# EAGLE design source_eagle (EAGLE 6.5.0)
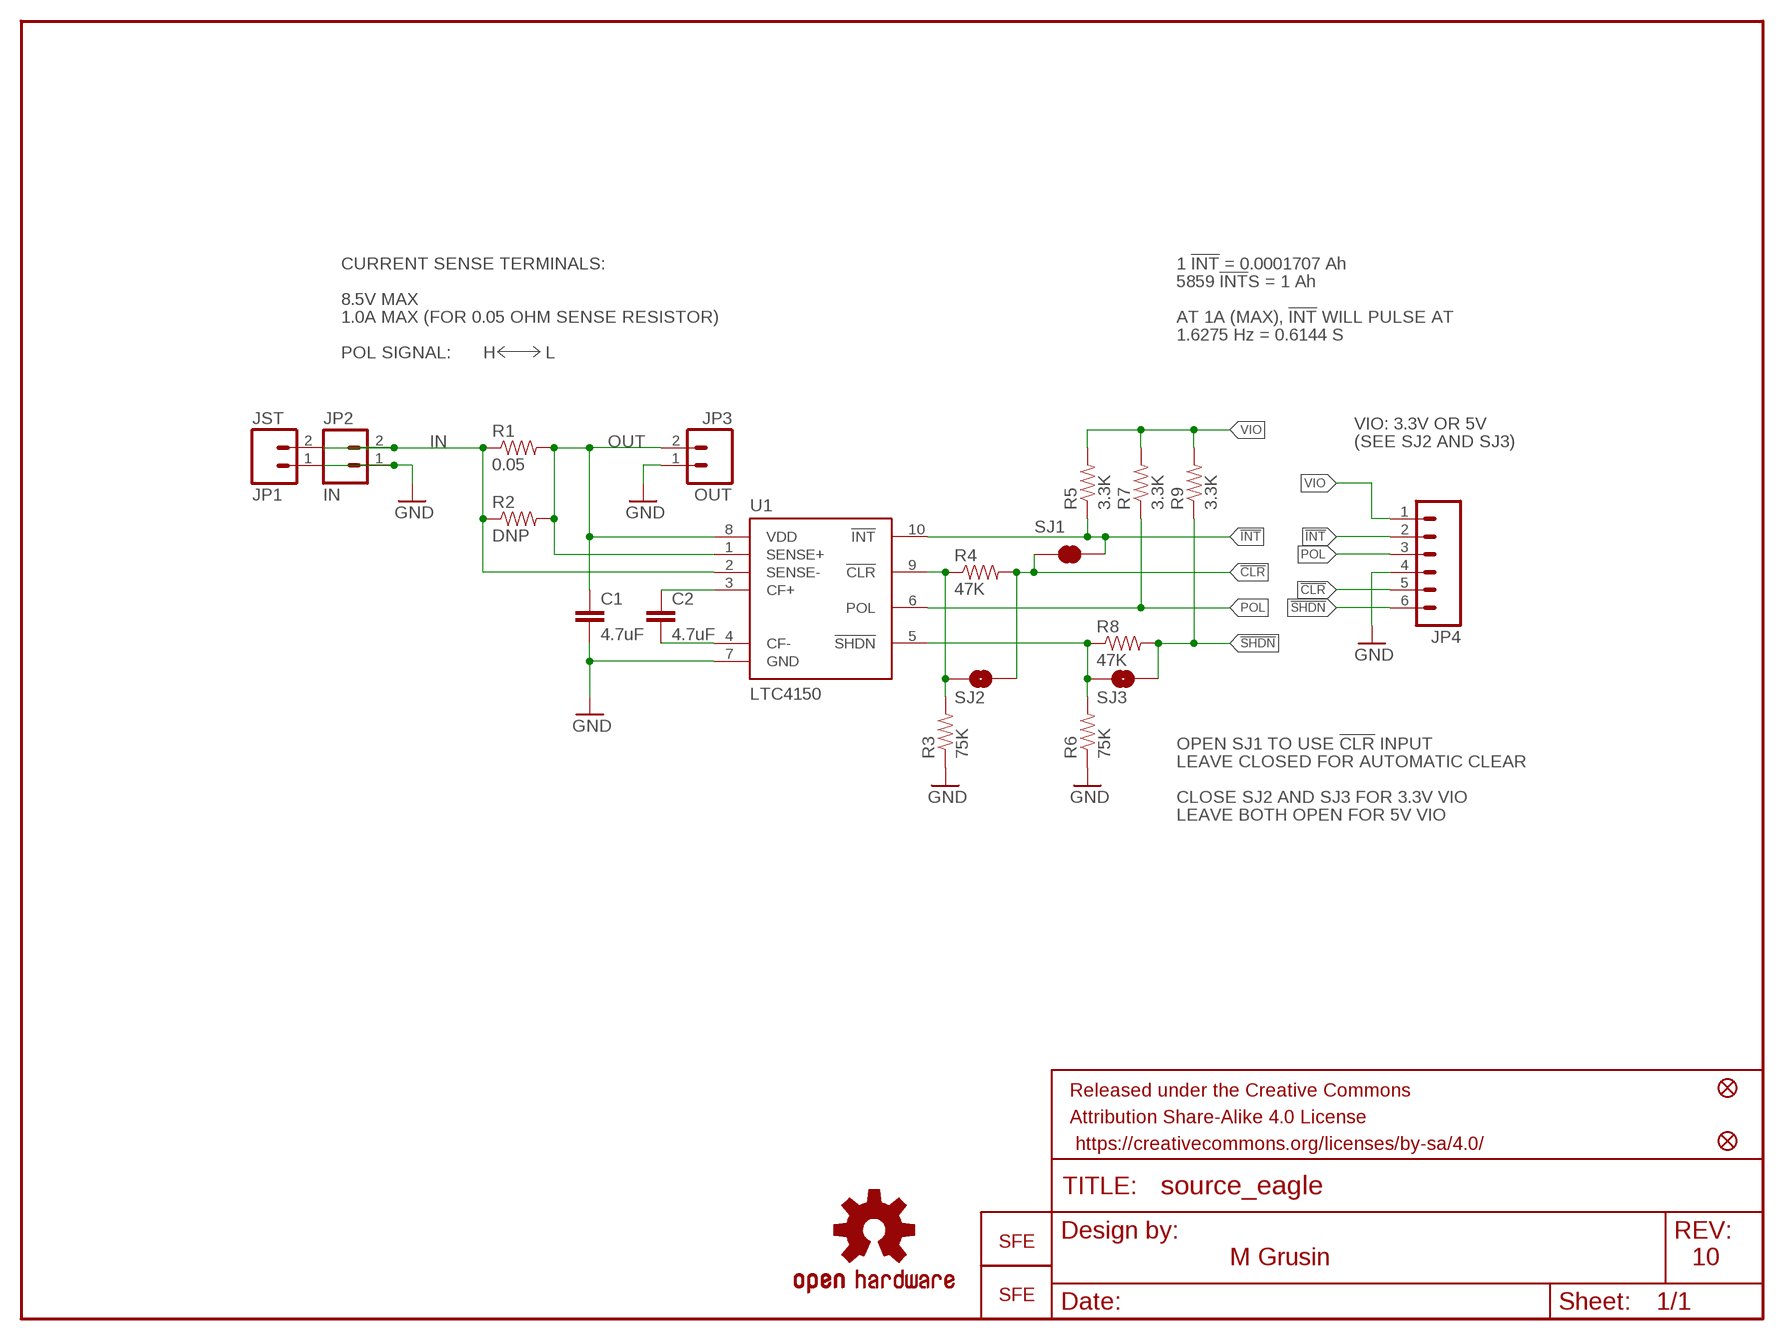
[diagram p0: schematic, sheet 1]

## Parts
C1  4.7uF  CAP0603-CAP  [0603-CAP]
C2  4.7uF  CAP0603-CAP  [0603-CAP]
FID1  FIDUCIAL1X2  [FIDUCIAL-1X2]
FID2  FIDUCIAL1X2  [FIDUCIAL-1X2]
FRAME1  FRAME-LETTER  [CREATIVE_COMMONS]
JP1  JST  M02-JST-2MM-SMT  [JST-2-SMD]
JP2  IN  M02PTH  [1X02]
JP3  OUT  M02PTH  [1X02]
JP4  M06SIP  [1X06]
LOGO1  OSHW-LOGOS  [OSHW-LOGO-S]
LOGO2  LOGO-SFENW2  [SFE-NEW-WEB]
LOGO3  LOGO-SFESK  [SFE-LOGO-FLAME]
R1  0.05  RESISTOR1206  [1206]
R2  DNP  RESISTORAXIAL-0.3  [AXIAL-0.3]
R3  75K  RESISTOR0603-RES  [0603-RES]
R4  47K  RESISTOR0603-RES  [0603-RES]
R5  3.3K  RESISTOR0603-RES  [0603-RES]
R6  75K  RESISTOR0603-RES  [0603-RES]
R7  3.3K  RESISTOR0603-RES  [0603-RES]
R8  47K  RESISTOR0603-RES  [0603-RES]
R9  3.3K  RESISTOR0603-RES  [0603-RES]
SJ1  SOLDERJUMPERNC  [SJ_2S]
SJ2  SOLDERJUMPERNO  [SJ_2S-NO]
SJ3  SOLDERJUMPERNO  [SJ_2S-NO]
U1  LTC4150  [MSOP10]

## Nets
!CLR!: JP4.5 R4.2 SJ1.1 SJ2.2
!INT!: JP4.2 R5.1 SJ1.2 U1.10(!INT!)
!SHDN!: JP4.6 R8.2 R9.1 SJ3.2
GND: C1.2 JP1.1 JP2.1 JP3.1 JP4.4 R3.1 R6.1 U1.7(GND)
IN: JP1.2 JP2.2 R1.1 R2.P$1 U1.2(SENSE-)
N$1: R3.2 R4.1 SJ2.1 U1.9(!CLR!)
N$3: C2.1 U1.3(CF+)
N$4: C2.2 U1.4(CF-)
N$9: R6.2 R8.1 SJ3.1 U1.5(!SHDN!)
OUT: C1.1 JP3.2 R1.2 R2.P$2 U1.1(SENSE+) U1.8(VDD)
POL: JP4.3 R7.1 U1.6(POL)
VIO: JP4.1 R5.2 R7.2 R9.2

## Notes on the sheet
- CURRENT SENSE TERMINALS: | 1 !INT! = 0.0001707 Ah
- 5859 !INT!S = 1 Ah
- 8.5V MAX
- 1.0A MAX (FOR 0.05 OHM SENSE RESISTOR) | AT 1A (MAX), !INT! WILL PULSE AT
- 1.6275 Hz = 0.6144 S
- POL SIGNAL: | H | L
- VIO: 3.3V OR 5V
- (SEE SJ2 AND SJ3)
- OPEN SJ1 TO USE !CLR! INPUT
- LEAVE CLOSED FOR AUTOMATIC CLEAR
- CLOSE SJ2 AND SJ3 FOR 3.3V VIO
- LEAVE BOTH OPEN FOR 5V VIO
- M Grusin | 10

## Library data of the parts
C1 C2 = SparkFun-Passives:CAP: Capacitor Standard 0603 ceramic capacitor, and 0.1" leaded capacitor.
FID1 FID2 = SparkFun-Aesthetics:FIDUCIAL: Fiducial Alignment Points Various fiducial points for machine vision alignment.
FRAME1 = SparkFun-Aesthetics:FRAME-LETTER: Schematic Frame Standard 8.5x11 US Letter frame
JP1 = SparkFun-Connectors:M02: Standard 2-pin 0.1" header. Use with - straight break away headers ( PRT-00116) - right angle break away headers (PRT-00553) - swiss pins (PRT-00743) - machine pins (PRT-00117) - female headers (PRT-00115) Molex polarized connector foot print use with: PRT-08233 with associated crimp pins and housings. 2.54_SCREWTERM for use with PRT-10571. 3.5mm Screw Terminal footprints for PRT-08084 5mm Screw Terminal footprints for use with PRT-08433; PROD_ID: CONN-08352
JP2 JP3 = SparkFun-Connectors:M02: Standard 2-pin 0.1" header. Use with - straight break away headers ( PRT-00116) - right angle break away headers (PRT-00553) - swiss pins (PRT-00743) - machine pins (PRT-00117) - female headers (PRT-00115) Molex polarized connector foot print use with: PRT-08233 with associated crimp pins and housings. 2.54_SCREWTERM for use with PRT-10571. 3.5mm Screw Terminal footprints for PRT-08084 5mm Screw Terminal footprints for use with PRT-08433
JP4 = SparkFun-Connectors:M06: Header 6 Standard 6-pin 0.1" header. Use with straight break away headers (SKU : PRT-00116), right angle break away headers (PRT-00553), swiss pins (PRT-00743), machine pins (PRT-00117), and female headers (PRT-00115). Molex polarized connector foot print use with SKU : PRT-08094 with associated crimp pins and housings. NOTES ON THE VARIANTS LOCK and LOCK_LONGPADS... This footprint was designed to help hold the alignment of a through-hole component (i.e. 6-pin header) while soldering it into place. You may notice that each hole has been shifted either up or down by 0.005 of an inch from it's more standard position (which is a perfectly straight line). This slight alteration caused the pins (the squares in the middle) to touch the edges of the holes. Because they are alternating, it causes a "brace" to hold the component in place. 0.005 has proven to be the perfect amount of "off-center" position when using our standard breakaway headers. Although looks a little odd when you look at the bare footprint, once you have a header in there, the alteration is very hard to notice. Also,if you push a header all the way into place, it is covered up entirely on the bottom side. This idea of altering the position of holes to aid alignment will be further integrated into the Sparkfun Library for other footprints. It can help hold any component with 3 or more connection pins.
LOGO1 = SparkFun-Aesthetics:OSHW-LOGO: Open Source Hardware Logo This logo indicates the piece of hardware it is found on incorporates a OSHW license and/or adheres to the definition of open source hardware found here: http://freedomdefined.org/OSHW
LOGO2 LOGO3 = SparkFun-Aesthetics:LOGO-SFE: Spark Fun Electronics PCB Logo This is the standard Spark Fun Electronics PCB logo.
R1-R9 = SparkFun-Passives:RESISTOR: Resistor Basic schematic elements and footprints for 0603, 1206, and PTH resistors.
SJ1-SJ3 = SparkFun-Passives:SOLDERJUMPER: Solder Jumper Standard SMD solder jumper. Used to automate production. Two varients : Normally Open and Normally Closed are the same, but have different paste layers. NC will have a large amount of paste and should jumper during reflow.
U1 = mike-temp:LTC4150

## Board
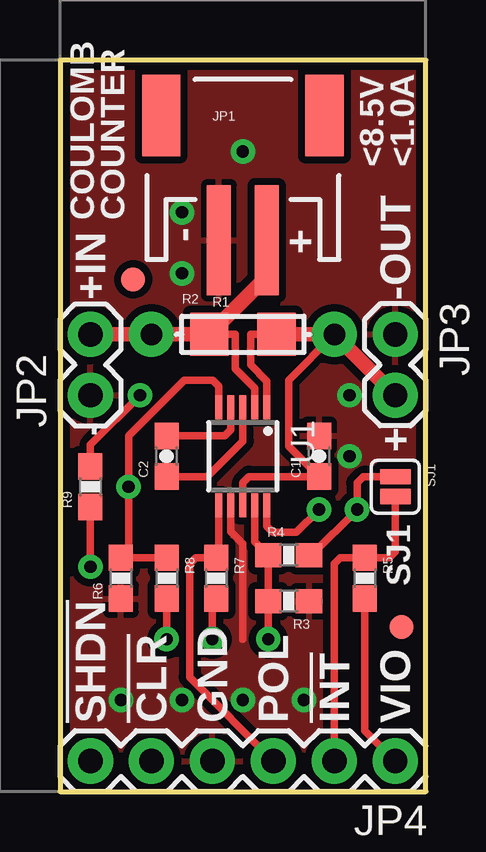
[diagram p1: board, top side]
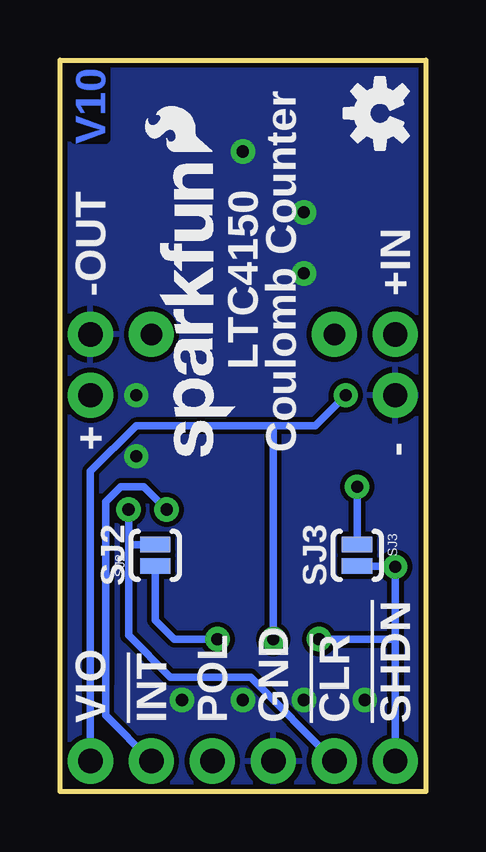
[diagram p2: board, bottom side, seen from below]

Size 15.24 x 30.48 mm. Coordinates in mm from the lower left corner, seen from the top.
Outline: 0,0 15.24,0 15.24,30.48 0,30.48 0,0
Copper layers (1*16): Top 0.035mm / dielectric 1.5mm / Bottom 0.035mm
Design rules "SparkFun *": minimum track width 7mil, minimum drill 15mil, track to track 8mil, track to pad 8mil, pad to pad 8mil, via to via 8mil, smd to smd 8mil, copper to edge 8mil, drill to drill 8mil, minimum pad ring 12mil, minimum via ring 10mil, stop-mask expansion 4mil, vias tented up to drill 20mil, thermal gap 10mil

### Footprints (pad centres in the part's own frame; a part is rotated, then mirrored left to right if it is on the bottom)
0603-CAP = smd 1.1 x 1: 1 -0.85,0; 2 0.85,0
FIDUCIAL-1X2 = smd 1 x 1: 1 0,0
JST-2-SMD = smd 1 x 4.6: 1 -1,-3.7; 2 1,-3.7 | smd 1.6 x 3.4: NC1 -3.4,1.5; NC2 3.4,1.5
1X02 = drill 1.016 pad 1.88: 1 0,0; 2 2.54,0
1X06 = drill 1.016 pad 1.88: 1 0,0; 2 2.54,0; 3 5.08,0; 4 7.62,0; 5 10.16,0; 6 12.7,0
1206 = smd 1.6 x 1.8: 1 -1.4,0; 2 1.4,0
AXIAL-0.3 = drill 0.9 pad 1.88: P$1 -3.81,0; P$2 3.81,0
0603-RES = smd 1.1 x 1: 1 -0.85,0; 2 0.85,0
SJ_2S = smd 0.635 x 1.27: 1 -0.412,0; 2 0.412,0
SJ_2S-NO = smd 0.635 x 1.27: 1 -0.45,0; 2 0.45,0
MSOP10 = smd 0.3 x 1: 1 -1,-2.05; 2 -0.5,-2.05; 3 0,-2.05; 4 0.5,-2.05; 5 1,-2.05; 6 1,2.05; 7 0.5,2.05; 8 0,2.05; 9 -0.5,2.05; 10 -1,2.05

### Placement (x,y rotation side)
C1  10.79,13.97 90 top
C2  4.45,13.97 90 top
FID1  3.05,21.34 0 top
FID2  14.22,6.86 0 top
FRAME1  not placed on the board
JP1  7.62,26.67 0 top
JP2  1.27,16.51 90 top
JP3  13.97,19.05 270 top
JP4  13.97,1.27 180 top
LOGO1  1.91,28.26 90 bottom
LOGO2  7.94,13.97 90 bottom
LOGO3  8.89,26.67 90 bottom
R1  7.62,19.05 0 top
R2  7.62,19.05 0 top
R3  9.53,7.94 180 top
R4  9.53,9.84 0 top
R5  12.7,8.89 270 top
R6  2.54,8.89 90 top
R7  6.51,8.89 270 top
R8  4.45,8.89 270 top
R9  1.27,12.7 90 top
SJ1  13.97,12.7 270 top
SJ2  11.27,9.84 90 bottom
SJ3  2.86,9.84 270 bottom
U1  7.62,13.97 180 top

### Tracks (layer width: path | path; a pad name or v marks a point on that pad's centre or on a via)
!CLR!  (via drill 0.51)
  Top 0.305: SJ1.1 12.64,13.11 12.38,12.86 v12.38,11.75 10.48,9.84 R4.2
  Bottom 0.305: SJ2.2 12.38,10.29 | 12.38,10.29 v12.38,11.75 | JP4.5 7.3,4.76 10.64,4.76 12.38,6.51 12.38,10.29
!INT!  (via drill 0.51)
  Top 0.305: JP4.2 11.43,9.49 11.68,9.74 R5.1 13.72,9.74 13.97,9.99 SJ1.2 14.35,12.29 | U1.10 8.62,11.05 8.87,10.79 9.84,10.79 v10.79,11.75
  Bottom 0.305: v10.79,11.75 11.75,12.7 12.7,12.7 13.34,12.06 13.34,4.45 13.34,3.17 JP4.2
!SHDN!  (via drill 0.51)
  Top 0.305: R8.2 v4.45,6.35 | R9.1 v1.27,9.37
  Bottom 0.305: 1.27,6.35 v1.27,9.37 1.27,9.39 SJ3.2 | 1.27,6.35 JP4.6 | v4.45,6.35 1.27,6.35
GND  (via drill 0.51)
  Top 0.305: U1.7 7.12,10.82 7.62,10.32 7.62,6.35
  other vias: 7.62,3.81 2.54,3.81 12.06,13.97 5.08,3.81 12.06,16.51 7.62,26.67 5.08,21.59 10.16,3.81 5.08,24.13
  pour Top (isolate 0.305): 0,30.48 15.24,30.48 15.24,0 0,0
  pour Bottom: 0,30.48 15.24,30.48 15.24,0 0,0
IN
  Top 0.305: R1.1 7.3,19.05 7.3,17.62 8.12,16.8 U1.2
  Top 0.61: JP2.2 R2.P$1 R1.1 8.62,21.45 JP1.2
N$1  (via drill 0.51)
  Top 0.305: U1.9 8.12,10.4 R4.1 R3.2 v8.68,6.35
  Bottom 0.305: v8.68,6.35 10.48,6.35 11.27,7.14 SJ2.1
N$3
  Top 0.305: C2.1 6.13,13.12 7.62,14.61 U1.3
N$4
  Top 0.305: C2.2 6.87,14.82 7.12,15.07 U1.4
N$9  (via drill 0.51)
  Top 0.305: R8.1 2.86,9.74 | U1.5 6.62,16.89 6.37,17.14 5.18,17.14 2.86,14.82 v2.86,12.7 2.86,9.74 | R6.2 2.86,9.74
  Bottom 0.305: SJ3.1 v2.86,12.7
OUT
  Top 0.305: U1.8 7.62,12.87 7.87,13.12 C1.1 9.53,14.39 9.53,17.14 R2.P$2 | R1.2 7.94,19.05 7.94,17.78 8.62,17.1 U1.1
  Top 0.61: R1.2 R2.P$2 JP3.2
POL
  Top 0.305: U1.6 6.62,9.74 R7.1 5.65,9.74 5.4,9.49 5.4,4.76 JP4.3
VIO  (via drill 0.51)
  Top 0.305: R5.2 12.7,2.54 JP4.1 | R7.2 6.35,8.04 v6.35,6.35 | v3.33,16.51 1.27,14.45 R9.2
  Bottom 0.305: v6.35,6.35 6.35,15.24 | 6.35,15.24 12.06,15.24 13.97,13.34 JP4.1 | v3.33,16.51 4.6,15.24 6.35,15.24

### Text on the board
Bottom: V10
tPlace: <8.5V | <1.0A | COULOMB | COUNTER | - | + | +IN | -OUT | - | + | SJ1 | !SHDN! | !CLR! | GND | POL | !INT! | VIO
bPlace: Coulomb Counter | LTC4150 | +IN | -OUT | + | - | SJ3 | SJ2 | !SHDN! | !CLR! | GND | POL | !INT! | VIO
tDocu: M Grusin